# Altium project main.PrjPcb
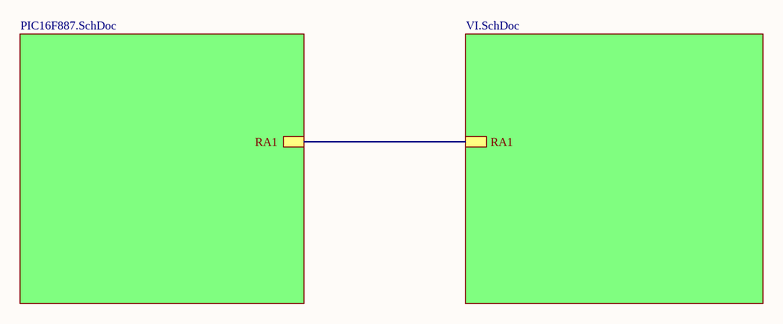
[diagram p0: main.SchDoc]
3 sheets, 62 parts. Net scope: hierarchical (ports join the sheet entries above them; power ports are global).
Sheets:
  main.SchDoc
    Designator = PIC16F887.SchDoc
    Designator = VI.SchDoc

## Sheet main.SchDoc
size A4

### Sub-sheets
Designator = PIC16F887.SchDoc: RA1
Designator = VI.SchDoc: RA1

### Nets
RA1: sheet Designator/RA1, sheet Designator/RA1

## Sheet PIC16F887.SchDoc
size A4
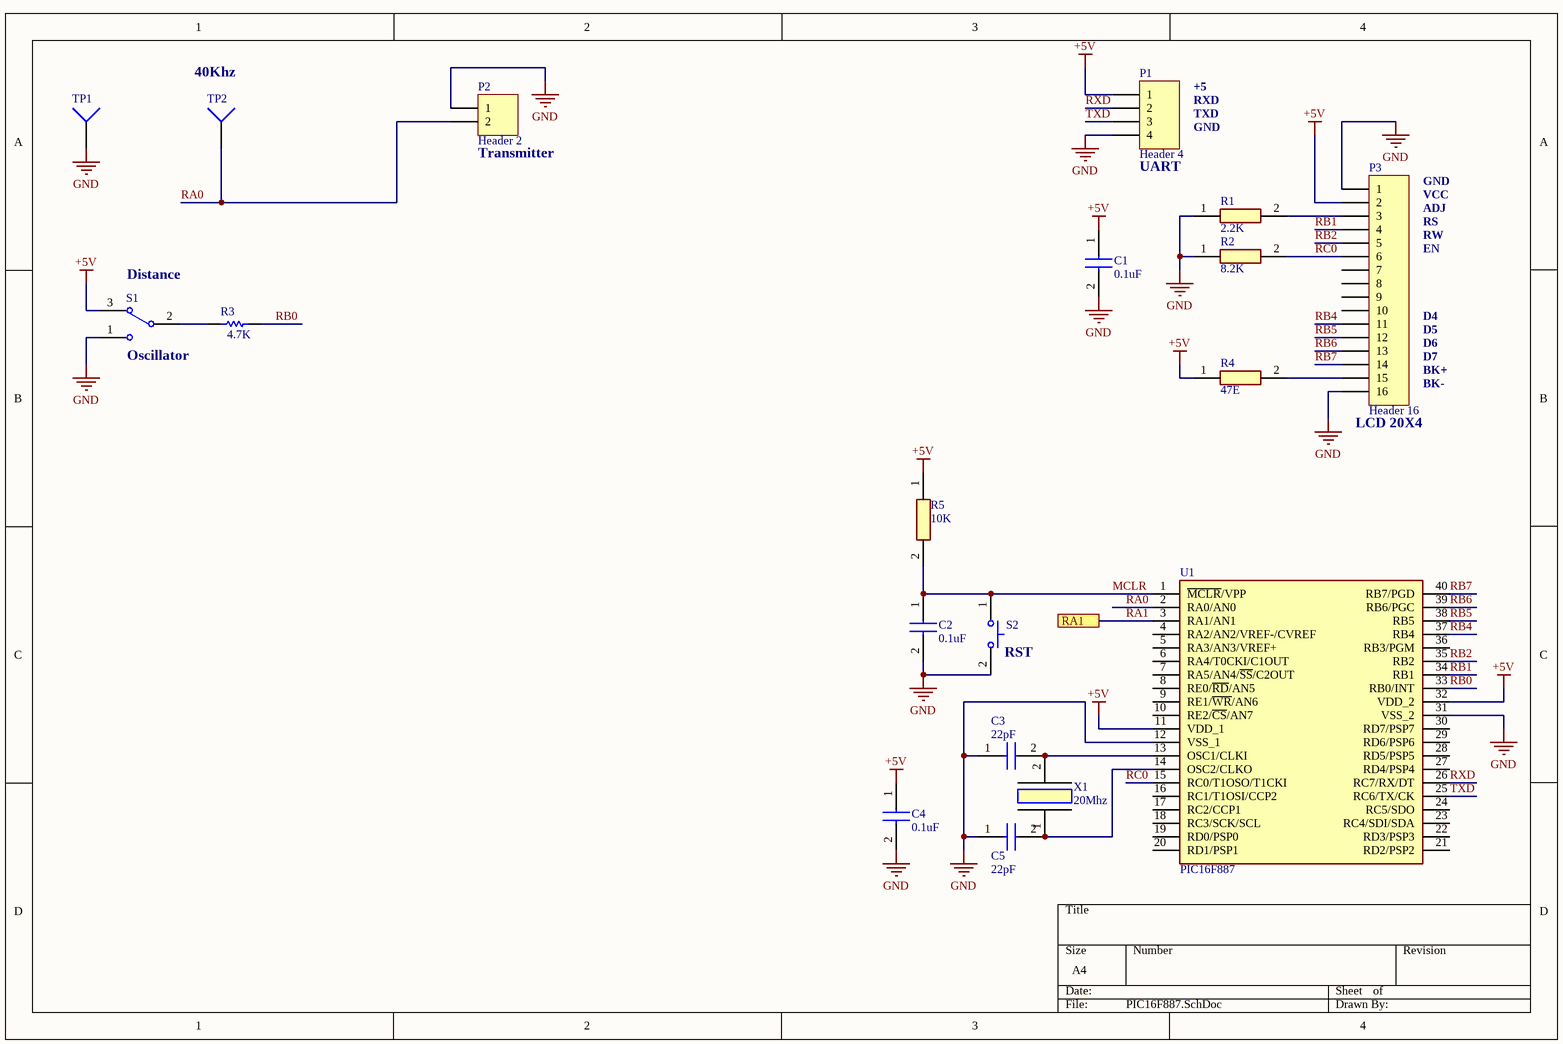
[diagram p1: PIC16F887.SchDoc]

### Parts
C1  0.1uF  [1C10X7R104K050B]
C2  0.1uF  [1C10X7R104K050B]
C3  22pF  [1C10X7R104K050B]
C4  0.1uF  [1C10X7R104K050B]
C5  22pF  [1C10X7R104K050B]
P1  Header 4  [HDR1X4]
P2  Header 2  [HDR1X2]
P3  Header 16  [HDR1X16]
R1  2.2K  [RESC3216X75N]
R2  8.2K  [RESC3216X75N]
R3  value 4.7K  [AXIAL-0.3]  (hidden comment: Res1)
R4  47E  [RESC3216X75N]
R5  10K  [RESC3216X75N]
S1  SW-SPDT  [TL36WW15050]  (value not drawn)
S2  SW_2PIN  [FSM2JRT]  (value not drawn)
TP1  Socket  [PIN1]  (value not drawn)
TP2  Socket  [PIN1]  (value not drawn)
U1  PIC16F887  [DIP1550W56P254L5219H483Q40N]
X1  20Mhz  [9B112896MEEJB]

### Ports
RA1

### Nets
+5V: C1.1 C4.1 P1.1 P3.2 R4.1 R5.1 S1.3 U1.11(VDD_1) U1.32(VDD_2)
GND: C1.2 C2.2 C3.1 C4.2 C5.1 P1.4 P2.1 P3.1 P3.16 R1.1 R2.1 S1.1 S2.2(NO) TP1.1 U1.12(VSS_1) U1.31(VSS_2)
MCLR: C2.1 R5.2 S2.1(COM) U1.1(~{MCLR}/VPP)
RA0: P2.2 TP2.1 U1.2(RA0/AN0)
RA1: U1.3(RA1/AN1) ; port RA1
RB0: R3.2 U1.33(RB0/INT)
RB1: P3.4 U1.34(RB1)
RB2: P3.5 U1.35(RB2)
RB4: P3.11 U1.37(RB4)
RB5: P3.12 U1.38(RB5)
RB6: P3.13 U1.39(RB6/PGC)
RB7: P3.14 U1.40(RB7/PGD)
RC0: P3.6 R2.2 U1.15(RC0/T1OSO/T1CKI)
RXD: P1.2 U1.26(RC7/RX/DT)
TXD: P1.3 U1.25(RC6/TX/CK)
NetC3_2: C3.2 U1.13(OSC1/CLKI) X1.2(CRYSTAL_2)
NetC5_2: C5.2 U1.14(OSC2/CLKO) X1.1(CRYSTAL_1)
NetP3_3: P3.3 R1.2
NetP3_15: P3.15 R4.2
NetR3_1: R3.1 S1.2

Not connected (* = marked no-connect by the designer): P3 7 8 9 10; U1 4(RA2/AN2/VREF-/CVREF) 5(RA3/AN3/VREF+) 6(RA4/T0CKI/C1OUT) 7(RA5/AN4/~{SS}/C2OUT) 8(RE0/~{RD}/AN5) 9(RE1/~{WR}/AN6) 10(RE2/~{CS}/AN7) 16(RC1/T1OSI/CCP2) 17(RC2/CCP1) 18(RC3/SCK/SCL) 19(RD0/PSP0) 20(RD1/PSP1) 21(RD2/PSP2) 22(RD3/PSP3) 23(RC4/SDI/SDA) 24(RC5/SDO) 27(RD4/PSP4) 28(RD5/PSP5) 29(RD6/PSP6) 30(RD7/PSP7) 36(RB3/PGM)

### Notes on the sheet
- (near TP2) 40Khz
- TXD
- RXD
- +5
- (near P2) Transmitter
- (near P1) UART
- GND
- RS
- RW
- EN
- VCC
- ADJ
- (near S1) Distance
- D4
- (near S1) Oscillator
- D5
- D6
- D7
- BK+
- BK-
- (near P3) LCD 20X4
- (near S2) RST

### Library data of the parts
C1-C5 = Cap_Disc_TH: Capacitor; Manufacturer_Name: Vishay; Datasheet Link: https://componentsearchengine.com/Datasheets/2/1C10X7R104K050B.pdf; Height: 6.35mm; Manufacturer_Part_Number: 1C10X7R104K050B; Arrow Part Number: 1C10X7R104K050B; Arrow Price/Stock: https://www.arrow.com/en/products/1c10x7r104k050b/vishay; Mouser Part Number: 75-1C10X7R104K050B; Mouser Price/Stock: https://www.mouser.co.uk/ProductDetail/Vishay/1C10X7R104K050B?qs=TIBb6vrNf0T8HspN1t%2FgBg%3D%3D
P1 = Header 4: Header, 4-Pin; LatestRevisionDate: 17-Jul-2002; LatestRevisionNote: Re-released for DXP Platform.; Publisher: Altium Limited
P2 = Header 2: Header, 2-Pin; LatestRevisionDate: 17-Jul-2002; LatestRevisionNote: Re-released for DXP Platform.; Publisher: Altium Limited
P3 = Header 16: Header, 16-Pin; LatestRevisionDate: 17-Jul-2002; LatestRevisionNote: Re-released for DXP Platform.; Publisher: Altium Limited
R1 R2 R4 R5 = R1206: Resistor; Manufacturer_Name: Bourns; Manufacturer_Part_Number: CR1206-FX-1001ELF; Allied_Number: 70155095; Datasheet Link: http://www.bourns.com/data/global/pdfs/CHPREZTR.pdf; Height: 0.75mm; Mouser Part Number: 652-CR1206FX-1001ELF; Mouser Price/Stock: https://www.mouser.com/Search/Refine.aspx?Keyword=652-CR1206FX-1001ELF; RS Part Number: 7409088P; RS Price/Stock: http://uk.rs-online.com/web/p/products/7409088P; Allied Price/Stock: http://www.alliedelec.com/bourns-cr1206-fx-1001elf/70155095/
R3 = Res1: Resistor; Published: 8-Jun-2000; LatestRevisionDate: 17-Jul-2002; LatestRevisionNote: Re-released for DXP Platform.; PackageReference: AXIAL-0.3; Publisher: Altium Limited; PackageDescription: Axial Device, Thru-Hole; 2 Leads; 0.3 in Pin Spacing
S1 = SW-SPDT: SPDT Subminiature Toggle Switch, Right Angle Mounting, Vertical Actuation; Published: 24-Mar-1999; LatestRevisionDate: 17-Dec-2003; LatestRevisionNote: Schematic revised, PCB Footprint replaced.; DatasheetVersion: 05-Dec-2000; PackageReference: TL36WW15050; Publisher: Altium Limited; PackageDescription: Switch; 4 Leads; ComponentLink1Description: Manufacturer Link; ComponentLink1URL: http://www.apem.com
S2 = SW_2PIN: Switch (2-Pin Push); Manufacturer_Name: TE Connectivity; Datasheet Link: http://www.farnell.com/datasheets/2074947.pdf; Height: 4.3mm; Manufacturer_Part_Number: FSM2JRT; Arrow Part Number: FSM2JRT; Arrow Price/Stock: https://www.arrow.com/en/products/fsm2jrt/te-connectivity; Mouser Part Number: 506-FSM2JRT; Mouser Price/Stock: https://www.mouser.co.uk/ProductDetail/TE-Connectivity-PB/FSM2JRT?qs=g%252BEszo6zu8OVk6hda53nSw%3D%3D
U1 = PIC16F877A-E_P: Integrated Circuit; Manufacturer_Name: Microchip; Manufacturer_Part_Number: PIC16F877A-E/P; Datasheet Link: https://datasheet.datasheetarchive.com/originals/distributors/Datasheets-18/DSA-359049.pdf; Height: 4.83mm; Mouser Part Number: 579-PIC16F877A-E/P; Mouser Price/Stock: https://www.mouser.co.uk/ProductDetail/Microchip-Technology-Atmel/PIC16F877A-E-P?qs=oKK8NaWdAJsQw%252B2Y417CHw%3D%3D; Arrow Part Number: PIC16F877A-E/P; Arrow Price/Stock: https://www.arrow.com/en/products/pic16f877a-ep/microchip-technology?region=nac
X1 = Crystal_ThruHole: Crystal or Oscillator; Manufacturer_Name: TXC; Manufacturer_Part_Number: 9B-11.2896MEEJ-B; Datasheet Link: https://www.arrow.com/en/products/9b-11.2896meej-b/txc-corporation; Height: 3.68mm; Arrow Part Number: 9B-11.2896MEEJ-B; Arrow Price/Stock: https://www.arrow.com/en/products/9b-11.2896meej-b/txc-corporation
TP1 TP2 = Socket: LatestRevisionDate: 17-Jul-2002; LatestRevisionNote: Re-released for DXP Platform.; Publisher: Altium Limited

## Sheet VI.SchDoc
size A4
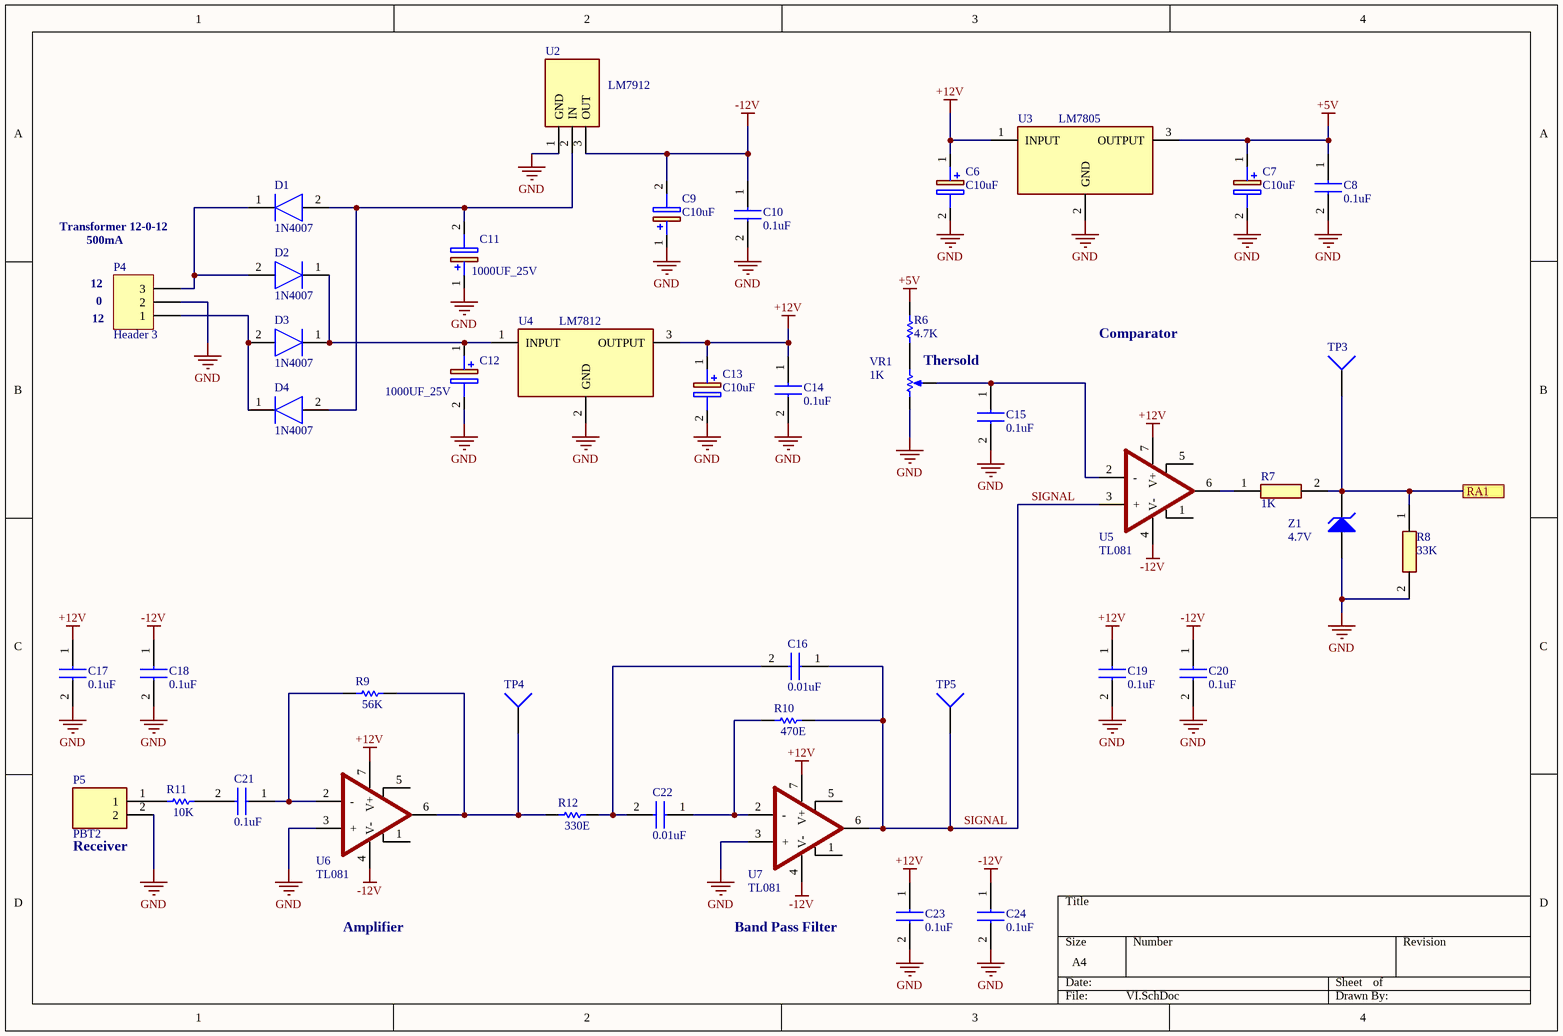
[diagram p2: VI.SchDoc]

### Parts
C6  C10uF  [CAPPRD250W50D680H1250]
C7  C10uF  [CAPPRD250W50D680H1250]
C8  0.1uF  [RESC3216X75N]
C9  C10uF  [CAPPRD250W50D680H1250]
C10  0.1uF  [RESC3216X75N]
C11  1000UF_25V  [CAPPRD500W60D1300H2650]
C12  1000UF_25V  [CAPPRD500W60D1300H2650]
C13  C10uF  [CAPPRD250W50D680H1250]
C14  0.1uF  [RESC3216X75N]
C15  0.1uF  [1C10X7R104K050B]
C16  0.01uF  [1C10X7R104K050B]
C17  0.1uF  [1C10X7R104K050B]
C18  0.1uF  [1C10X7R104K050B]
C19  0.1uF  [1C10X7R104K050B]
C20  0.1uF  [1C10X7R104K050B]
C21  0.1uF  [1C10X7R104K050B]
C22  0.01uF  [1C10X7R104K050B]
C23  0.1uF  [1C10X7R104K050B]
C24  0.1uF  [1C10X7R104K050B]
D1  1N4007  [DIOAD1165W56L425D185]
D2  1N4007  [DIOAD1165W56L425D185]
D3  1N4007  [DIOAD1165W56L425D185]
D4  1N4007  [DIOAD1165W56L425D185]
P4  Header 3  [HDR1X3]
P5  PBT2  [TB00750802BE]
R6  value 4.7K  [AXIAL-0.3]  (hidden comment: Res1)
R7  1K  [RESC3216X75N]
R8  33K  [RESC3216X75N]
R9  value 56K  [AXIAL-0.3]  (hidden comment: Res1)
R10  value 470E  [AXIAL-0.3]  (hidden comment: Res1)
R11  value 10K  [AXIAL-0.3]  (hidden comment: Res1)
R12  value 330E  [AXIAL-0.3]  (hidden comment: Res1)
TP3  Socket  [PIN1]  (value not drawn)
TP4  Socket  [PIN1]  (value not drawn)
TP5  Socket  [PIN1]  (value not drawn)
U2  LM7912  [TO254P470X1016X2019-3P]
U3  LM7805  [TO254P470X1028X1955-3P]
U4  LM7812  [TO254P470X1028X1955-3P]
U5  TL081  [DIP794W53P254L959H508Q8N]
U6  TL081  [DIP794W53P254L959H508Q8N]
U7  TL081  [DIP794W53P254L959H508Q8N]
VR1  value 1K  [VR5]  (hidden comment: RPot)
Z1  4.7V  [DIODE-0.7]

### Ports
RA1

### Nets
+5V: C7.1(+) C8.1 R6.2 U3.3(OUTPUT)
+12V: C6.1(+) C13.1(+) C14.1 C17.1 C19.1 C23.1 U3.1(INPUT) U4.3(OUTPUT) U5.7(V+) U6.7(V+) U7.7(V+)
-12V: C9.2(-) C10.1 C18.1 C20.1 C24.1 U2.3(OUT) U5.4(V-) U6.4(V-) U7.4(V-)
GND: C6.2(-) C7.2(-) C8.2 C9.1(+) C10.2 C11.1(+) C12.2(-) C13.2(-) C14.2 C15.2 C17.2 C18.2 C19.2 C20.2 C23.2 C24.2 P4.2 P5.2 R8.2 U2.1(GND) U3.2(GND) U4.2(GND) U6.3(+) U7.3(+) VR1.1(TOP) Z1.1(A)
RA1: R7.2 R8.1 TP3.1 Z1.2(K) ; port RA1
SIGNAL: C16.1 R10.2 TP5.1 U5.3(+) U7.6(OUTPUT)
NetC11_2: C11.2(-) D1.2(A) D4.2(A) U2.2(IN)
NetC12_1: C12.1(+) D2.1(K) D3.1(K) U4.1(INPUT)
NetC15_1: C15.1 U5.2(-) VR1.3(TAP)
NetC16_2: C16.2 C22.2 R12.2
NetC21_1: C21.1 R9.1 U6.2(-)
NetC21_2: C21.2 R11.2
NetC22_1: C22.1 R10.1 U7.2(-)
NetD1_1: D1.1(K) D2.2(A) P4.3
NetD3_2: D3.2(A) D4.1(K) P4.1
NetP5_1: P5.1 R11.1
NetR6_1: R6.1 VR1.2(BOT)
NetR7_1: R7.1 U5.6(OUTPUT)
NetR9_2: R9.2 R12.1 TP4.1 U6.6(OUTPUT)

Not connected (* = marked no-connect by the designer): U5 1(OFFSET_NULL_1) 5(OFFSET_NULL_2); U6 1(OFFSET_NULL_1) 5(OFFSET_NULL_2); U7 1(OFFSET_NULL_1) 5(OFFSET_NULL_2)

### Notes on the sheet
- Transformer 12-0-12
- 500mA
- (near P4) 12
- (near P4) 0
- (near VR1) Thersold
- Comparator
- (near P5) Receiver
- Amplifier
- Band Pass Filter

### Library data of the parts
C6 C7 C9 C13 = C10uF_ThruHole: Capacitor Polarised; Manufacturer_Name: Rubycon; Manufacturer_Part_Number: 100YXF10MEFC6.3X11; Datasheet Link: https://componentsearchengine.com/Datasheets/2/100YXF10MEFC6.3X11.pdf; Height: 12.5mm; Arrow Part Number: 100YXF10MEFC6.3X11; Arrow Price/Stock: https://www.arrow.com/en/products/100yxf10mefc6.3x11/rubycon; Mouser Part Number: 232-100YXF10MEFC63X1; Mouser Price/Stock: https://www.mouser.co.uk/ProductDetail/Rubycon/100YXF10MEFC63X11?qs=T3oQrply3y9i7TRjfOdsfg%3D%3D
C8 C10 C14 = C1206: Capacitor; Manufacturer_Name: TDK; Manufacturer_Part_Number: C3216C0G1H103J060AA; Datasheet Link: https://product.tdk.com/info/en/catalog/datasheets/mlcc_commercial_midvoltage_en.pdf; Height: 0.75mm; Mouser Part Number: 810-C3216C0G1H103J-1; Mouser Price/Stock: https://www.mouser.co.uk/ProductDetail/TDK/C3216C0G1H103J060AA?qs=LcTL%2F5vFEzGNu8aMmVNq%252Bg%3D%3D; RS Part Number: 7407467P; RS Price/Stock: http://uk.rs-online.com/web/p/products/7407467P
C11 C12 = C1000UF_25V: Capacitor Polarised; Manufacturer_Name: United Chemi-Con; Manufacturer_Part_Number: EKY-350ELL102MK25S; Datasheet Link: https://www.mouser.com/datasheet/2/420/United-Chemi-Con-1109128.pdf; Height: 26.5mm; Arrow Part Number: EKY-350ELL102MK25S; Arrow Price/Stock: https://www.arrow.com/en/products/eky-350ell102mk25s/united-chemi-con; Mouser Part Number: 661-EKY350ELL102MK2; Mouser Price/Stock: https://www.mouser.com/Search/Refine.aspx?Keyword=661-EKY350ELL102MK2
C15-C24 = Cap_Disc_TH: Capacitor; Manufacturer_Name: Vishay; Datasheet Link: https://componentsearchengine.com/Datasheets/2/1C10X7R104K050B.pdf; Height: 6.35mm; Manufacturer_Part_Number: 1C10X7R104K050B; Arrow Part Number: 1C10X7R104K050B; Arrow Price/Stock: https://www.arrow.com/en/products/1c10x7r104k050b/vishay; Mouser Part Number: 75-1C10X7R104K050B; Mouser Price/Stock: https://www.mouser.co.uk/ProductDetail/Vishay/1C10X7R104K050B?qs=TIBb6vrNf0T8HspN1t%2FgBg%3D%3D
D1-D4 = 1N4148: Diode; Manufacturer_Name: Nexperia; Datasheet Link: http://www.nxp.com/documents/data_sheet/1N4148_1N4448.pdf; Manufacturer_Part_Number: 1N4148
P4 = Header 3: Header, 3-Pin; LatestRevisionDate: 17-Jul-2002; LatestRevisionNote: Re-released for DXP Platform.; Publisher: Altium Limited
P5 = PBT2: Connector; Manufacturer_Name: CUI Devices; Manufacturer_Part_Number: TB007-508-02BE; Datasheet Link: https://www.mouser.com/datasheet/2/670/tb007-508-1550621.pdf; Height: 14mm; Arrow Part Number: TB007-508-02BE; Arrow Price/Stock: https://www.arrow.com/en/products/tb007-508-02be/cui-devices; Mouser Part Number: 490-TB007-508-02BE; Mouser Price/Stock: https://www.mouser.co.uk/ProductDetail/CUI-Devices/TB007-508-02BE?qs=vLWxofP3U2y6PFKAfCqKUQ%3D%3D
R6 R9-R12 = Res1: Resistor; Published: 8-Jun-2000; LatestRevisionDate: 17-Jul-2002; LatestRevisionNote: Re-released for DXP Platform.; PackageReference: AXIAL-0.3; Publisher: Altium Limited; PackageDescription: Axial Device, Thru-Hole; 2 Leads; 0.3 in Pin Spacing
R7 R8 = R1206: as R1 on sheet PIC16F887; Datasheet Link: http://www.bourns.com/data/global/pdfs/CHPREZTR.pdf; Height: 0.75mm; Mouser Part Number: 652-CR1206FX-1001ELF; Mouser Price/Stock: https://www.mouser.com/Search/Refine.aspx?Keyword=652-CR1206FX-1001ELF; RS Part Number: 7409088P; RS Price/Stock: http://uk.rs-online.com/web/p/products/7409088P; Allied Price/Stock: http://www.alliedelec.com/bourns-cr1206-fx-1001elf/70155095/
U2 = LM7915CT: Integrated Circuit; Manufacturer_Name: ON Semiconductor; Datasheet Link: http://www.onsemi.com/pub/Collateral/LM7918-D.pdf; Height: 4.7mm; Manufacturer_Part_Number: LM7915CT; Mouser Part Number: 512-LM7915CT; Mouser Price/Stock: https://www.mouser.co.uk/ProductDetail/ON-Semiconductor-Fairchild/LM7915CT?qs=AxPfoIcMNKKE4cliBai9zA%3D%3D; Arrow Part Number: LM7915CT; Arrow Price/Stock: https://www.arrow.com/en/products/lm7915ct/on-semiconductor
U3 U4 = LM7815CT: Integrated Circuit; Manufacturer_Name: Texas Instruments; Datasheet Link: http://www.ti.com/lit/ds/symlink/lm340.pdf; Height: 4.7mm; Manufacturer_Part_Number: LM7815CT; Mouser Part Number: 926-LM7815CT; Mouser Price/Stock: https://www.mouser.co.uk/ProductDetail/Texas-Instruments/LM7815CT?qs=QbsRYf82W3FGdlGQoRPhHw%3D%3D
U5-U7 = LM741_DIP: Integrated Circuit; Manufacturer_Name: Texas Instruments; Manufacturer_Part_Number: LM741CN/NOPB-936607701; Datasheet Link: https://www.arrow.com/en/products/lm741cnnopb-936607701/texas-instruments; Height: 5.08mm; Arrow Part Number: LM741CN/NOPB-936607701; Arrow Price/Stock: https://www.arrow.com/en/products/lm741cnnopb-936607701/texas-instruments
VR1 = RPot: Potentiometer; Sim Note: Enter the Resistance value and the set point into parameter fields.; Set Position: 0.5; Published: 8-Jun-2000; LatestRevisionDate: 17-Jul-2002; LatestRevisionNote: Re-released for DXP Platform.; PackageReference: VR5; Publisher: Altium Limited; PackageDescription: Variable Resistor, Thru-Hole; 3 Leads
Z1 = D Zener: Zener Diode; Published: 8-Jun-2000; LatestRevisionDate: 17-Jul-2002; LatestRevisionNote: Re-released for DXP Platform.; PackageReference: DIODE-0.7; Publisher: Altium Limited; PackageDescription: Diode, Thru-Hole; 2 Leads; 0.7 in Pin Spacing
TP3-TP5 = Socket: LatestRevisionDate: 17-Jul-2002; LatestRevisionNote: Re-released for DXP Platform.; Publisher: Altium Limited

## Nets that join several sheets
+5V: PIC16F887 (9 pins), VI (C7.1 C8.1 R6.2 U3.3)
GND: PIC16F887 (16 pins), VI (26 pins)
RA1: PIC16F887 (U1.3), VI (R7.2 R8.1 TP3.1 Z1.2)